# Altium project Sound_Sensor.PrjPcb (part 2 of 3)

## Sheet ADC_2_Section.SchDoc
size A4; DocumentNumber: 7; SheetNumber: 7; SheetTotal: 7
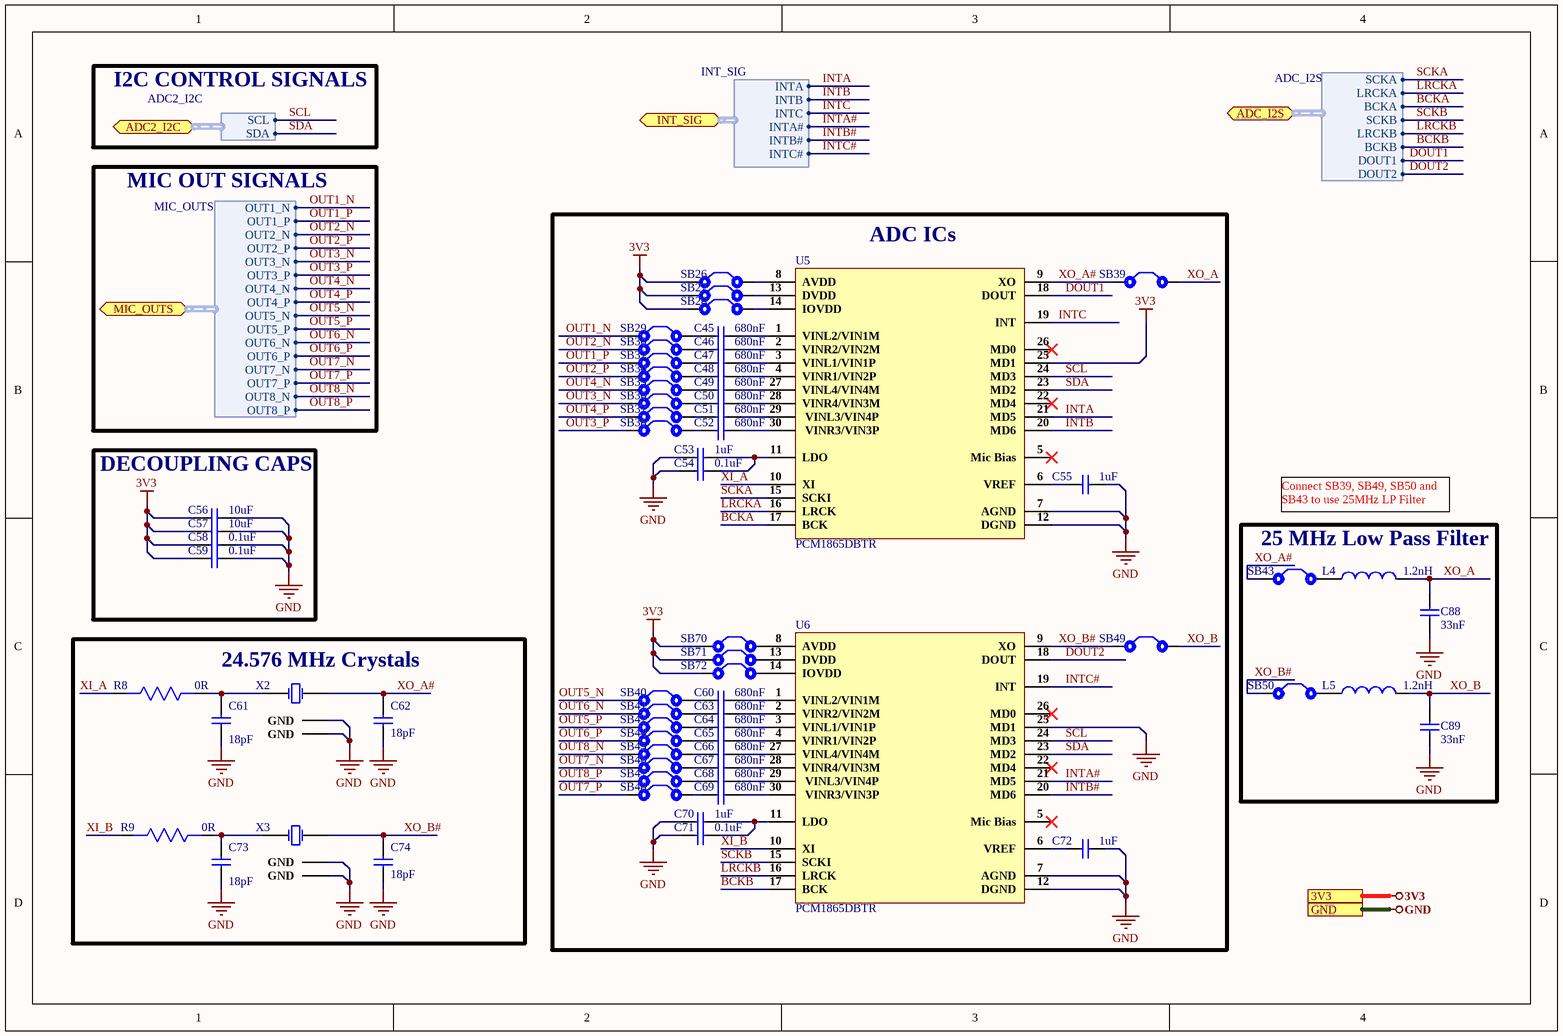
[diagram p3: ADC_2_Section.SchDoc]

### Parts
C45  680nF  [Cap 0603]
C46  680nF  [Cap 0603]
C47  680nF  [Cap 0603]
C48  680nF  [Cap 0603]
C49  680nF  [Cap 0603]
C50  680nF  [Cap 0603]
C51  680nF  [Cap 0603]
C52  680nF  [Cap 0603]
C53  1uF  [Cap 0603]
C54  0.1uF  [Cap 0603]
C55  1uF  [Cap 0603]
C56  10uF  [Cap 0603]
C57  10uF  [Cap 0603]
C58  0.1uF  [Cap 0603]
C59  0.1uF  [Cap 0603]
C60  680nF  [Cap 0603]
C61  18pF  [Cap 0603]
C62  18pF  [Cap 0603]
C63  680nF  [Cap 0603]
C64  680nF  [Cap 0603]
C65  680nF  [Cap 0603]
C66  680nF  [Cap 0603]
C67  680nF  [Cap 0603]
C68  680nF  [Cap 0603]
C69  680nF  [Cap 0603]
C70  1uF  [Cap 0603]
C71  0.1uF  [Cap 0603]
C72  1uF  [Cap 0603]
C73  18pF  [Cap 0603]
C74  18pF  [Cap 0603]
C88  33nF  [Cap 0603]
C89  33nF  [Cap 0603]
L4  1.2nH  [IND 0402]
L5  1.2nH  [IND 0402]
R8  0R  [Res0603]
R9  0R  [Res0603]
SB26  Solder Bridge  [Solder Bridge]  (value not drawn)
SB27  Solder Bridge  [Solder Bridge]  (value not drawn)
SB28  Solder Bridge  [Solder Bridge]  (value not drawn)
SB29  Solder Bridge  [Solder Bridge]  (value not drawn)
SB30  Solder Bridge  [Solder Bridge]  (value not drawn)
SB32  Solder Bridge  [Solder Bridge]  (value not drawn)
SB34  Solder Bridge  [Solder Bridge]  (value not drawn)
SB35  Solder Bridge  [Solder Bridge]  (value not drawn)
SB36  Solder Bridge  [Solder Bridge]  (value not drawn)
SB37  Solder Bridge  [Solder Bridge]  (value not drawn)
SB38  Solder Bridge  [Solder Bridge]  (value not drawn)
SB39  Solder Bridge  [Solder Bridge]  (value not drawn)
SB40  Solder Bridge  [Solder Bridge]  (value not drawn)
SB41  Solder Bridge  [Solder Bridge]  (value not drawn)
SB42  Solder Bridge  [Solder Bridge]  (value not drawn)
SB43  Solder Bridge  [Solder Bridge]  (value not drawn)
SB44  Solder Bridge  [Solder Bridge]  (value not drawn)
SB45  Solder Bridge  [Solder Bridge]  (value not drawn)
SB46  Solder Bridge  [Solder Bridge]  (value not drawn)
SB47  Solder Bridge  [Solder Bridge]  (value not drawn)
SB48  Solder Bridge  [Solder Bridge]  (value not drawn)
SB49  Solder Bridge  [Solder Bridge]  (value not drawn)
SB50  Solder Bridge  [Solder Bridge]  (value not drawn)
SB70  Solder Bridge  [Solder Bridge]  (value not drawn)
SB71  Solder Bridge  [Solder Bridge]  (value not drawn)
SB72  Solder Bridge  [Solder Bridge]  (value not drawn)
U5  PCM1865DBTR  [PCM1865DBTR]
U6  PCM1865DBTR  [PCM1865DBTR]
X2  S3224576121060  [S3224576121060]  (value not drawn)
X3  S3224576121060  [S3224576121060]  (value not drawn)

### Blocks framed on the sheet
ADC ICs: C45-C55 C60 C63-C72 SB26-SB30 SB32 SB34-SB42 SB44-SB49 SB70-SB72 U5 U6
DECOUPLING CAPS: C56-C59
25 MHz Low Pass Filter: C88 C89 L4 L5 SB43 SB50
24.576 MHz Crystals: C61 C62 C73 C74 R8 R9 X2 X3

### Ports
3V3, ADC2_I2C (bidir, harness ADC2_I2C), ADC_I2S (bidir, harness ADC_I2S), GND, INT_SIG (bidir, harness INT_SIG), MIC_OUTS (bidir, harness MIC_OUTS)

### Harnesses
MIC_OUTS: OUT1_N, OUT1_P, OUT2_N, OUT2_P, OUT3_N, OUT3_P, OUT4_N, OUT4_P, OUT5_N, OUT5_P, OUT6_N, OUT6_P, OUT7_N, OUT7_P, OUT8_N, OUT8_P
ADC_I2S: SCKA, LRCKA, BCKA, SCKB, LRCKB, BCKB, DOUT1, DOUT2
INT_SIG: INTA, INTB, INTC, INTA#, INTB#, INTC#
ADC2_I2C: SCL, SDA

### Nets
3V3: C56.1 C57.1 C58.1 C59.1 SB26.1 SB27.1 SB28.1 SB70.1 SB71.1 SB72.1 U5.25(MD1) ; port 3V3
GND: C53.1 C54.1 C55.2 C56.2 C57.2 C58.2 C59.2 C61.1 C62.1 C70.1 C71.1 C72.2 C73.1 C74.1 C88.1 C89.1 U5.7(AGND) U5.12(DGND) U6.7(AGND) U6.12(DGND) U6.25(MD1) X2.2(GND) X2.4(GND) X3.2(GND) X3.4(GND) ; port GND
BCKA: U5.17(BCK) ; port ADC_I2S.BCKA
BCKB: U6.17(BCK) ; port ADC_I2S.BCKB
DOUT1: U5.18(DOUT) ; port ADC_I2S.DOUT1
DOUT2: U6.18(DOUT) ; port ADC_I2S.DOUT2
INTA: U5.21(MD5) ; port INT_SIG.INTA
INTA#: U6.21(MD5) ; port INT_SIG.INTA#
INTB: U5.20(MD6) ; port INT_SIG.INTB
INTB#: U6.20(MD6) ; port INT_SIG.INTB#
INTC: U5.19(INT) ; port INT_SIG.INTC
INTC#: U6.19(INT) ; port INT_SIG.INTC#
LRCKA: U5.16(LRCK) ; port ADC_I2S.LRCKA
LRCKB: U6.16(LRCK) ; port ADC_I2S.LRCKB
OUT1_N: SB29.1 ; port MIC_OUTS.OUT1_N  [project net MIC_OUTS.OUT1_N]
OUT1_P: SB32.1 ; port MIC_OUTS.OUT1_P  [project net MIC_OUTS.OUT1_P]
OUT2_N: SB30.1 ; port MIC_OUTS.OUT2_N  [project net MIC_OUTS.OUT2_N]
OUT2_P: SB34.1 ; port MIC_OUTS.OUT2_P  [project net MIC_OUTS.OUT2_P]
OUT3_N: SB36.1 ; port MIC_OUTS.OUT3_N  [project net MIC_OUTS.OUT3_N]
OUT3_P: SB38.1 ; port MIC_OUTS.OUT3_P  [project net MIC_OUTS.OUT3_P]
OUT4_N: SB35.1 ; port MIC_OUTS.OUT4_N  [project net MIC_OUTS.OUT4_N]
OUT4_P: SB37.1 ; port MIC_OUTS.OUT4_P  [project net MIC_OUTS.OUT4_P]
OUT5_N: SB40.1 ; port MIC_OUTS.OUT5_N  [project net MIC_OUTS.OUT5_N]
OUT5_P: SB42.1 ; port MIC_OUTS.OUT5_P  [project net MIC_OUTS.OUT5_P]
OUT6_N: SB41.1 ; port MIC_OUTS.OUT6_N  [project net MIC_OUTS.OUT6_N]
OUT6_P: SB44.1 ; port MIC_OUTS.OUT6_P  [project net MIC_OUTS.OUT6_P]
OUT7_N: SB46.1 ; port MIC_OUTS.OUT7_N  [project net MIC_OUTS.OUT7_N]
OUT7_P: SB48.1 ; port MIC_OUTS.OUT7_P  [project net MIC_OUTS.OUT7_P]
OUT8_N: SB45.1 ; port MIC_OUTS.OUT8_N  [project net MIC_OUTS.OUT8_N]
OUT8_P: SB47.1 ; port MIC_OUTS.OUT8_P  [project net MIC_OUTS.OUT8_P]
SCKA: U5.15(SCKI) ; port ADC_I2S.SCKA
SCKB: U6.15(SCKI) ; port ADC_I2S.SCKB
SCL: U5.24(MD3) U6.24(MD3) ; port ADC2_I2C.SCL
SDA: U5.23(MD2) U6.23(MD2) ; port ADC2_I2C.SDA
XI_A: R8.2 U5.10(XI)
XI_B: R9.2 U6.10(XI)
XO_A: C88.2 L4.2 SB39.2
XO_A#: C62.2 SB39.1 SB43.1 U5.9(XO) X2.3(OSC2)
XO_B: C89.2 L5.2 SB49.2
XO_B#: C74.2 SB49.1 SB50.1 U6.9(XO) X3.3(OSC2)
NetC45_1: C45.1 SB29.2
NetC45_2: C45.2 U5.1(VINL2/VIN1M)
NetC46_1: C46.1 SB30.2
NetC46_2: C46.2 U5.2(VINR2/VIN2M)
NetC47_1: C47.1 SB32.2
NetC47_2: C47.2 U5.3(VINL1/VIN1P)
NetC48_1: C48.1 SB34.2
NetC48_2: C48.2 U5.4(VINR1/VIN2P)
NetC49_1: C49.1 SB35.2
NetC49_2: C49.2 U5.27(VINL4/VIN4M)
NetC50_1: C50.1 SB36.2
NetC50_2: C50.2 U5.28(VINR4/VIN3M)
NetC51_1: C51.1 SB37.2
NetC51_2: C51.2 U5.29(VINL3/VIN4P)
NetC52_1: C52.1 SB38.2
NetC52_2: C52.2 U5.30(VINR3/VIN3P)
NetC53_2: C53.2 C54.2 U5.11(LDO)
NetC55_1: C55.1 U5.6(VREF)
NetC60_1: C60.1 SB40.2
NetC60_2: C60.2 U6.1(VINL2/VIN1M)
NetC61_2: C61.2 R8.1 X2.1(OSC1)
NetC63_1: C63.1 SB41.2
NetC63_2: C63.2 U6.2(VINR2/VIN2M)
NetC64_1: C64.1 SB42.2
NetC64_2: C64.2 U6.3(VINL1/VIN1P)
NetC65_1: C65.1 SB44.2
NetC65_2: C65.2 U6.4(VINR1/VIN2P)
NetC66_1: C66.1 SB45.2
NetC66_2: C66.2 U6.27(VINL4/VIN4M)
NetC67_1: C67.1 SB46.2
NetC67_2: C67.2 U6.28(VINR4/VIN3M)
NetC68_1: C68.1 SB47.2
NetC68_2: C68.2 U6.29(VINL3/VIN4P)
NetC69_1: C69.1 SB48.2
NetC69_2: C69.2 U6.30(VINR3/VIN3P)
NetC70_2: C70.2 C71.2 U6.11(LDO)
NetC72_1: C72.1 U6.6(VREF)
NetC73_2: C73.2 R9.1 X3.1(OSC1)
NetL4_1: L4.1 SB43.2
NetL5_1: L5.1 SB50.2
NetSB26_2: SB26.2 U5.8(AVDD)
NetSB27_2: SB27.2 U5.13(DVDD)
NetSB28_2: SB28.2 U5.14(IOVDD)
NetSB70_2: SB70.2 U6.8(AVDD)
NetSB71_2: SB71.2 U6.13(DVDD)
NetSB72_2: SB72.2 U6.14(IOVDD)

Not connected (* = marked no-connect by the designer): U5 5(Mic_Bias)* 22(MD4)* 26(MD0)*; U6 5(Mic_Bias)* 22(MD4)* 26(MD0)*

### Notes on the sheet
- I2C CONTROL SIGNALS
- MIC OUT SIGNALS
- Connect SB39, SB49, SB50 and SB43 to use 25MHz LP Filter

### Library data of the parts
C45-C52 C60 C63-C69 = CC0603KRX7R8BB684: CAP CER 0.68uF 25V X7R 10% 0603 Paper T/R; Manufacturer: Yageo; Supplier 1: Arrow Electronics; Manufacturer Part Number: CC0603KRX7R8BB684; RoHS: Yes; Category: Ceramic Capacitors; Stock 1: 8000; Pricing 1: 4000=0.02130, 8000=0.01830 (USD); Supplier Part Number 1: CC0603KRX7R8BB684
C53 C55 C70 C72 = CC0603KRX5R8BB105: CAP CER 1UF 25V X5R 0603; Manufacturer: Yageo; Tolerance: 10%; Supplier 1: Digi-Key; Manufacturer Part Number: CC0603KRX5R8BB105; RoHS: Yes; Category: Ceramic Capacitors; Stock 1: 919939; Pricing 1: 1=0.12000, 10=0.08400, 50=0.04760, 100=0.03940, 500=0.02764, 1000=0.02288 (USD); Mount: Surface Mount; Case/Package: 0603; Number of Pins: 2; Case Code (Metric): 1608; Case Code (Imperial): 0603; Min Operating Temperature: -55°C; Max Operating Temperature: 85°C; Capacitance: 1uF; Dielectric: X5R; Package Quantity: 1; Voltage Rating: 25V; Packaging: Tape and Reel; Termination: SMD/SMT; Voltage Rating (DC): 25V; Series: CC; Construction: Flat; Length: 1.6mm; Width: 0.031inch; Height: 0.8mm; Thickness: 0.035inch; Depth: 0.8mm; Radiation Hardening: No; REACH SVHC: No SVHC; Lead Free: Lead Free; Halogen Free: Halogen Free; RoHS Compliant: Yes; ComponentLink1URL: https://datasheet.ciiva.com/176/mlccorderingcode-176785.pdf?src-supplier=Digi-Key; ComponentLink1Description: https://datasheet.ciiva.com/176/mlccorderingcode-176785.pdf?src-supplier=Digi-Key; ComponentLink2URL: https://datasheet.ciiva.com/176/mlccorderingcode-176786.pdf?src-supplier=Digi-Key; ComponentLink2Description: https://datasheet.ciiva.com/176/mlccorderingcode-176786.pdf?src-supplier=Digi-Key; ComponentLink3URL: https://datasheet.ciiva.com/176/mlccorderingcode-176787.pdf?src-supplier=Digi-Key; ComponentLink3Description: https://datasheet.ciiva.com/176/mlccorderingcode-176787.pdf?src-supplier=Digi-Key; ComponentLink4URL: https://datasheet.ciiva.com/17436/upy-gphc-x5r-4v-to-50v-12-17436952.pdf?src-supplier=Avnet+Europe; ComponentLink4Description: https://datasheet.ciiva.com/17436/upy-gphc-x5r-4v-to-50v-12-17436952.pdf?src-supplier=Avnet+Europe; ComponentLink5URL: https://datasheet.ciiva.com/7978/1525783-7978171.pdf?src-supplier=Element14; ComponentLink5Description: https://datasheet.ciiva.com/7978/1525783-7978171.pdf?src-supplier=Element14; ComponentLink6URL: https://datasheet.ciiva.com/11586/upy-gphc-x5r-4v-to-50v-12-11586318.pdf?src-supplier=Avnet; ComponentLink6Description: https://datasheet.ciiva.com/11586/upy-gphc-x5r-4v-to-50v-12-11586318.pdf?src-supplier=Avnet; Supplier Part Number 1: 311-1445-1-ND
C54 C58 C59 C71 = CC0603KRX7R0BB104: CAP CER 0.1UF 100V X7R 0603; Manufacturer: Yageo; Capacitance: 100nF; Tolerance: 10%; Supplier 1: Digi-Key; Manufacturer Part Number: CC0603KRX7R0BB104; RoHS: Yes; Category: Ceramic Capacitors; Stock 1: 60476; Pricing 1: 1=0.19000, 10=0.13500, 50=0.07680, 100=0.06370, 500=0.04466, 1000=0.03696 (USD); Mount: Surface Mount; Case/Package: 0603; Case Code (Metric): 1608; Case Code (Imperial): 0603; Weight: 7.1E-05oz; Min Operating Temperature: -55°C; Max Operating Temperature: 125°C; Package Quantity: 4000; Voltage Rating: 100V; Packaging: Tape and Reel; Dielectric: X7R; Termination: SMD/SMT; Resistor Type: Ceramic; Voltage Rating (DC): 100V; Series: CC; Length: 0.063inch; Width: 0.031inch; Thickness: 0.035inch; Depth: 0.8mm; Lead Free: Lead Free; RoHS Compliant: Yes; ComponentLink1URL: https://datasheet.ciiva.com/6277/mlccorderingcode-6277030.pdf?src-supplier=Digi-Key; ComponentLink1Description: https://datasheet.ciiva.com/6277/mlccorderingcode-6277030.pdf?src-supplier=Digi-Key; ComponentLink2URL: https://datasheet.ciiva.com/6277/mlccorderingcode-6277081.pdf?src-supplier=Digi-Key; ComponentLink2Description: https://datasheet.ciiva.com/6277/mlccorderingcode-6277081.pdf?src-supplier=Digi-Key; ComponentLink3URL: https://datasheet.ciiva.com/6277/mlccorderingcode-6277082.pdf?src-supplier=Digi-Key; ComponentLink3Description: https://datasheet.ciiva.com/6277/mlccorderingcode-6277082.pdf?src-supplier=Digi-Key; Supplier Part Number 1: 311-1523-1-ND
C56 C57 = CL10A106MA8NRNC: CAP CER 10UF 25V X5R 0603; Manufacturer: Samsung; Tolerance: 20%; Supplier 1: Avnet; Manufacturer Part Number: CL10A106MA8NRNC; RoHS: Yes; Category: Ceramic Capacitors; Pricing 1: 4000=0.03753, 8000=0.03700, 16000=0.03595, 24000=0.03515, 32000=0.03383, 40000=0.03304, 400000=0.03225 (USD); Mount: Surface Mount; Case/Package: 0603; Case Code (Metric): 1608; Case Code (Imperial): 0603; Contact Plating: Tin; Min Operating Temperature: -55°C; Max Operating Temperature: 85°C; Package Quantity: 1; Packaging: Tape and Reel; Capacitance: 10uF; Voltage Rating: 25V; Dielectric: X5R; Termination: Wraparound; Series: CL; Construction: Flat; Length: 0.063inch; Width: 0.031inch; Thickness: 0.035inch; Lead Free: Lead Free; RoHS Compliant: Yes; ComponentLink1URL: https://datasheet.ciiva.com/25766/cl10a106ma8nrnc-25766562.pdf?src-supplier=Digi-Key; ComponentLink1Description: https://datasheet.ciiva.com/25766/cl10a106ma8nrnc-25766562.pdf?src-supplier=Digi-Key; Supplier Part Number 1: CL10A106MA8NRNC
C61 C62 C73 C74 = CC0603JRNPO9BN180: CAP SMD 18pF ±5.0% 50V NPO 0603; Manufacturer: Yageo; Tolerance: 5%; Dielectric: C0G; Temperature Coefficient: 30ppm/°C; Insulation Resistance: 100GR; Supplier 1: Newark; Manufacturer Part Number: CC0603JRNPO9BN180; RoHS: Yes; Category: Ceramic Capacitors; Stock 1: 77880; Pricing 1: 1=0.09900, 25=0.08000, 50=0.06900, 100=0.04700, 250=0.03600, 500=0.02800, 1000=0.02300, 2500=0.01900 (USD); Mount: Surface Mount; Case/Package: 0603; Number of Pins: 2; Case Code (Metric): 1608; Case Code (Imperial): 0603; Min Operating Temperature: -55°C; Max Operating Temperature: 125°C; Capacitance: 18pF; Packaging: Tape and Reel; Voltage Rating: 50V; Voltage Rating (DC): 50V; Package Quantity: 1; Termination: SMD/SMT; Resistor Type: Ceramic; Series: CC; Length: 1.6mm; Width: 0.031inch; Height: 0.8mm; Thickness: 0.035inch; Depth: 0.8mm; Radiation Hardening: No; REACH SVHC: No SVHC; Lead Free: Lead Free; RoHS Compliant: Yes; ComponentLink1URL: https://datasheet.ciiva.com/144/mlccorderingcode-144638.pdf?src-supplier=Digi-Key; ComponentLink1Description: https://datasheet.ciiva.com/144/mlccorderingcode-144638.pdf?src-supplier=Digi-Key; ComponentLink2URL: https://datasheet.ciiva.com/144/mlccorderingcode-144637.pdf?src-supplier=Digi-Key; ComponentLink2Description: https://datasheet.ciiva.com/144/mlccorderingcode-144637.pdf?src-supplier=Digi-Key; ComponentLink3URL: https://datasheet.ciiva.com/144/mlccorderingcode-144639.pdf?src-supplier=Digi-Key; ComponentLink3Description: https://datasheet.ciiva.com/144/mlccorderingcode-144639.pdf?src-supplier=Digi-Key; ComponentLink4URL: https://datasheet.ciiva.com/28450/1443161-28450477.pdf?src-supplier=Element14; ComponentLink4Description: https://datasheet.ciiva.com/28450/1443161-28450477.pdf?src-supplier=Element14; ComponentLink5URL: https://datasheet.ciiva.com/46430/1835847-46430152.pdf?src-supplier=Element14; ComponentLink5Description: https://datasheet.ciiva.com/46430/1835847-46430152.pdf?src-supplier=Element14; ComponentLink6URL: https://datasheet.ciiva.com/5425/upy-gp-np0-16v-to-50v-8-5425439.pdf?src-supplier=Mouser; ComponentLink6Description: https://datasheet.ciiva.com/5425/upy-gp-np0-16v-to-50v-8-5425439.pdf?src-supplier=Mouser; ComponentLink7URL: https://datasheet.ciiva.com/8033/1734582-8033733.pdf?src-supplier=Element14; ComponentLink7Description: https://datasheet.ciiva.com/8033/1734582-8033733.pdf?src-supplier=Element14; ComponentLink8URL: https://datasheet.ciiva.com/11587/upy-gp-np0-16v-to-50v-8-11587323.pdf?src-supplier=Avnet; ComponentLink8Description: https://datasheet.ciiva.com/11587/upy-gp-np0-16v-to-50v-8-11587323.pdf?src-supplier=Avnet; Supplier Part Number 1: 68R4719
C88 C89 = CC0603KRX7R8BB333: CAP CER 33000pF ±10% 25V X7R 0603; Manufacturer: Yageo; Supplier 1: Newark; Manufacturer Part Number: CC0603KRX7R8BB333; RoHS: Yes; Category: Ceramic Capacitors; Stock 1: 52000; Pricing 1: 1=0.01800, 4000=0.01800, 8000=0.01300 (USD); Mount: Surface Mount; Case/Package: 0603; Number of Pins: 2; Case Code (Imperial): 0603; Case Code (Metric): 1608; Weight: 7.1E-05oz; Min Operating Temperature: -55°C; Max Operating Temperature: 125°C; Tolerance: 10%; Voltage Rating: 25V; Capacitance: 33nF; Voltage Rating (DC): 25V; Packaging: Tape and Reel; Dielectric: X7R; Termination: SMD/SMT; Resistor Type: Ceramic; Series: CC; Length: 1.6mm; Width: 0.031inch; Height: 0.8mm; Thickness: 0.035inch; Depth: 0.8mm; Radiation Hardening: No; Lead Free: Lead Free; Halogen Free: Halogen Free; RoHS Compliant: Yes; ComponentLink1URL: https://datasheet.ciiva.com/11465/upy-gphc-x7r-6-3v-to-50v-8-11465208.pdf?src-supplier=Avnet; ComponentLink1Description: https://datasheet.ciiva.com/11465/upy-gphc-x7r-6-3v-to-50v-8-11465208.pdf?src-supplier=Avnet; ComponentLink2URL: https://datasheet.ciiva.com/15189/getdatasheetpartid-355839-15189164.pdf?src-supplier=Verical; ComponentLink2Description: https://datasheet.ciiva.com/15189/getdatasheetpartid-355839-15189164.pdf?src-supplier=Verical; Supplier Part Number 1: 50AJ2719
L4 L5 = LQG15HS1N2S02D: FIXED IND 1.2NH 1A 90 MOHM SMD; Manufacturer: Murata; Core Material: Air; DC Resistance (DCR): 90mR; Max DC Current: 300mA; Shielding: Unshielded; Q Factor: 8; Self Resonant Frequency: 6GHz; Test Frequency: 100MHz; Supplier 1: RSComponents; Manufacturer Part Number: LQG15HS1N2S02D; RoHS: Yes; Category: Fixed Inductors; Stock 1: 1; Pricing 1: 100=0.04000, 5000=0.02800, 10000=0.02200, 20000=0.02000, 50000=0.01700 (USD); Mount: Surface Mount; Case/Package: 0402; Case Code (Metric): 1005; Case Code (Imperial): 0402; Min Operating Temperature: -55°C; Max Operating Temperature: 125°C; Inductance: 1.2nH; Package Quantity: 10000; Current Rating: 300mA; Packaging: Tape and Reel; Termination: SMD/SMT; DC Current: 300mA; Series: LQG15HS; Rated Current-Max: 300mA; Length: 1mm; Width: 0.02inch; Height: 0.5mm; Height - Seated (Max): 0.022inch; Depth: 0.55mm; Radiation Hardening: No; Military Standard: Not; Lead Free: Lead Free; RoHS Compliant: Yes; ComponentLink1URL: https://datasheet.ciiva.com/11801/0900766b8090d53b-11801370.pdf?src-supplier=RSComponents; ComponentLink1Description: https://datasheet.ciiva.com/11801/0900766b8090d53b-11801370.pdf?src-supplier=RSComponents; ComponentLink2URL: https://datasheet.ciiva.com/16207/product-16207869.pdf?src-supplier=Future+Electronics; ComponentLink2Description: https://datasheet.ciiva.com/16207/product-16207869.pdf?src-supplier=Future+Electronics; ComponentLink3URL: https://datasheet.ciiva.com/1038/l0075s0083lqg15hs-1038116.pdf?src-supplier=Digi-Key; ComponentLink3Description: https://datasheet.ciiva.com/1038/l0075s0083lqg15hs-1038116.pdf?src-supplier=Digi-Key; ComponentLink4URL: https://datasheet.ciiva.com/1038/l0075s0083lqg15hs-1038115.pdf?src-supplier=Digi-Key; ComponentLink4Description: https://datasheet.ciiva.com/1038/l0075s0083lqg15hs-1038115.pdf?src-supplier=Digi-Key; ComponentLink5URL: https://datasheet.ciiva.com/1038/l0075s0083lqg15hs-1038117.pdf?src-supplier=Digi-Key; ComponentLink5Description: https://datasheet.ciiva.com/1038/l0075s0083lqg15hs-1038117.pdf?src-supplier=Digi-Key; ComponentLink6URL: https://datasheet.ciiva.com/4977/o05e-4977850.pdf?src-supplier=Mouser; ComponentLink6Description: https://datasheet.ciiva.com/4977/o05e-4977850.pdf?src-supplier=Mouser; ComponentLink7URL: https://datasheet.ciiva.com/8510/l0075s0083lqg15hs-8510828.pdf?src-supplier=Avnet; ComponentLink7Description: https://datasheet.ciiva.com/8510/l0075s0083lqg15hs-8510828.pdf?src-supplier=Avnet; Supplier Part Number 1: 8119795
R8 R9 = RC0603FR-070RL: RES SMD 0R, 1%, 0.1W, 0603; Manufacturer: Yageo; Resistance: 0mR; Power Rating: 100mW; Voltage Rating (DC): 50V; Temperature Coefficient: 200ppm/°C; Current Rating: 1A; Working Voltage: 75V; Supplier 1: Arrow Electronics; Manufacturer Part Number: RC0603FR-070RL; RoHS: Yes; Category: Chip SMD Resistors; Stock 1: 1270000; Pricing 1: 5000=0.00320, 5000=0.00490, 50000=0.00450, 500000=0.00250, 2500000=0.00150 (USD); Case/Package: 0603; Number of Pins: 2; Contact Plating: Tin,Matte; Case Code (Metric): 1608; Case Code (Imperial): 0603; Min Operating Temperature: -55°C; Max Operating Temperature: 155°C; Resistor Type: Thick Film; Packaging: Tape and Reel; Tolerance: 1%; Package Quantity: 5000; Voltage Rating: 50V; Number of Terminations: 2; Termination: SMD/SMT; Max Power Dissipation: 100mW; Features: Moisture Resistant; Length: 1.6mm; Width: 0.031inch; Height: 0.45mm; Depth: 0.8mm; Radiation Hardening: No; REACH SVHC: No SVHC; Lead Free: Lead Free; Military Standard: Not; ComponentLink1URL: https://datasheet.ciiva.com/11808/0900766b80f96399-11808172.pdf?src-supplier=RSComponents; ComponentLink1Description: https://datasheet.ciiva.com/11808/0900766b80f96399-11808172.pdf?src-supplier=RSComponents; ComponentLink2URL: https://datasheet.ciiva.com/5558/rc0603-272842-5558341.pdf?src-supplier=Mouser; ComponentLink2Description: https://datasheet.ciiva.com/5558/rc0603-272842-5558341.pdf?src-supplier=Mouser; ComponentLink3URL: https://datasheet.ciiva.com/46382/443971-46382072.pdf?src-supplier=Element14; ComponentLink3Description: https://datasheet.ciiva.com/46382/443971-46382072.pdf?src-supplier=Element14; ComponentLink4URL: https://datasheet.ciiva.com/29721/pyu-r-int-thick-7-29721178.pdf?src-supplier=Digi-Key; ComponentLink4Description: https://datasheet.ciiva.com/29721/pyu-r-int-thick-7-29721178.pdf?src-supplier=Digi-Key; ComponentLink5URL: https://datasheet.ciiva.com/5684/443971-5684699.pdf?src-supplier=Farnell; ComponentLink5Description: https://datasheet.ciiva.com/5684/443971-5684699.pdf?src-supplier=Farnell; ComponentLink6URL: https://datasheet.ciiva.com/7983/443971-7983627.pdf?src-supplier=Element14; ComponentLink6Description: https://datasheet.ciiva.com/7983/443971-7983627.pdf?src-supplier=Element14; ComponentLink7URL: https://datasheet.ciiva.com/29721/pyu-rc0603-51-rohs-l-4-29721179.pdf?src-supplier=Digi-Key; ComponentLink7Description: https://datasheet.ciiva.com/29721/pyu-rc0603-51-rohs-l-4-29721179.pdf?src-supplier=Digi-Key; ComponentLink8URL: https://datasheet.ciiva.com/22643/1868787-22643388.pdf?src-supplier=Element14; ComponentLink8Description: https://datasheet.ciiva.com/22643/1868787-22643388.pdf?src-supplier=Element14; Supplier Part Number 1: RC0603FR-070RL
SB26-SB30 SB32 SB34-SB50 SB70-SB72 = Solder Bridge: Solder Bridge ON
U5 U6 = PCM1865DBTR: IC ADC/AUDIO 24BIT 192K 30TSSOP; Manufacturer: Texas Instruments; Interface: I2C,SPI,Serial; Operating Supply Voltage: 3.3V; Sampling Rate: 192KS/s; Resolution: 24b; Operating Supply Current: 31mA; Supply Type: Single; Number of A/D Converters: 4; Power Consumption: 145mW; Max Supply Voltage: 3.6V; Min Supply Voltage: 3V; Number of Analog Inputs: 8; Number of DAC Channels: 0; Supplier 1: Mouser; Manufacturer Part Number: PCM1865DBTR; RoHS: Yes; Category: Amplifiers - Audio; Pricing 1: 1=10.72000, 10=9.69000, 25=9.23000, 50=9.23000, 100=8.02000, 250=7.66000, 500=6.98000, 1000=6.54000, 10000=6.54000 (USD); Mount: Surface Mount; Case/Package: TSSOP; Number of Pins: 30; Weight: 0.003439oz; Contact Plating: Gold; Min Operating Temperature: -40°C; Max Operating Temperature: 125°C; Package Quantity: 2000; Packaging: Tape and Reel; Number of ADC Channels: 4; Lead Free: Lead Free; RoHS Compliant: Yes; ComponentLink1URL: https://datasheet.ciiva.com/48474/pcm1861-48474798.pdf?src-supplier=Avnet; ComponentLink1Description: https://datasheet.ciiva.com/48474/pcm1861-48474798.pdf?src-supplier=Avnet; ComponentLink2URL: https://datasheet.ciiva.com/29699/pcm1861-29699238.pdf?src-supplier=Digi-Key; ComponentLink2Description: https://datasheet.ciiva.com/29699/pcm1861-29699238.pdf?src-supplier=Digi-Key; Supplier Part Number 1: 595-PCM1865DBTR
X2 X3 = S3224576121060: 24.576MHz SMD Crystal Resonator 12pF 60Ω ±10ppm -40℃~+85℃ SMD3225-4P Crystals ROHS; Manufacturer: JGHC; Manufacturer Part Number: S3224576121060; Footprint: Custom; ComponentLink1Description: LCSC; ComponentLink1URL: https://lcsc.com/product-detail/Crystals_JGHC-S3224576121060_C390772.html; Value: 24.576MHz

## Sheet ADC_1_Section.SchDoc
size A4; DocumentNumber: 6; SheetNumber: 6; SheetTotal: 7
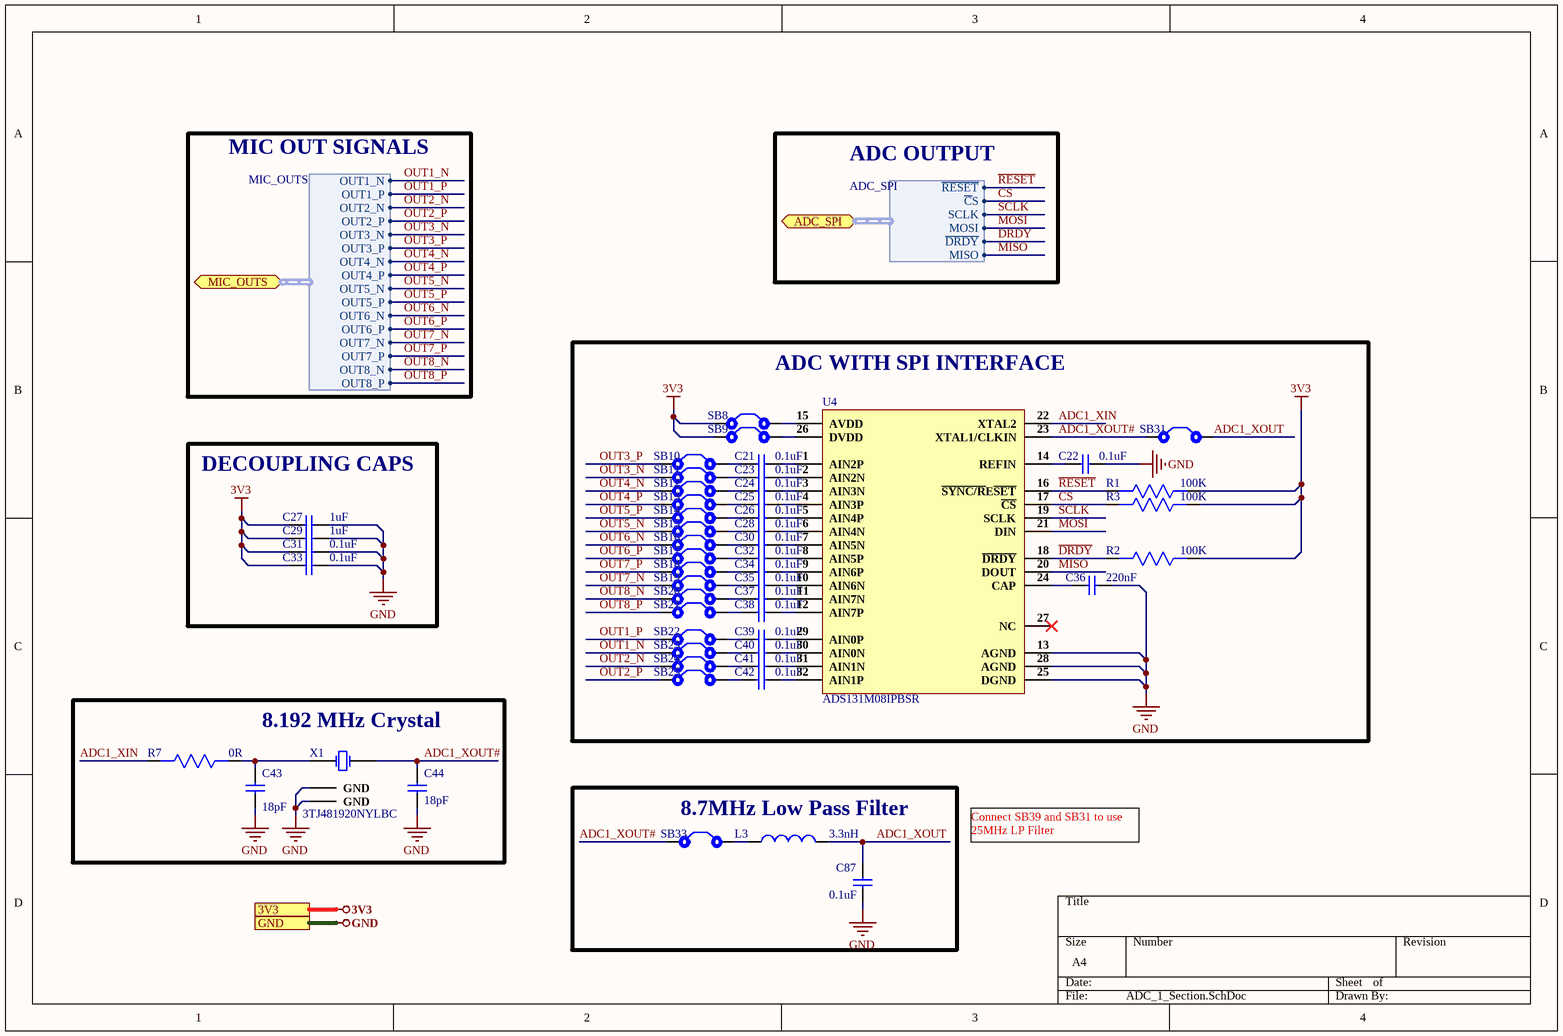
[diagram p4: ADC_1_Section.SchDoc]

### Parts
C21  0.1uF  [Cap 0603]
C22  0.1uF  [Cap 0603]
C23  0.1uF  [Cap 0603]
C24  0.1uF  [Cap 0603]
C25  0.1uF  [Cap 0603]
C26  0.1uF  [Cap 0603]
C27  1uF  [Cap 0603]
C28  0.1uF  [Cap 0603]
C29  1uF  [Cap 0603]
C30  0.1uF  [Cap 0603]
C31  0.1uF  [Cap 0603]
C32  0.1uF  [Cap 0603]
C33  0.1uF  [Cap 0603]
C34  0.1uF  [Cap 0603]
C35  0.1uF  [Cap 0603]
C36  220nF  [Cap 0603]
C37  0.1uF  [Cap 0603]
C38  0.1uF  [Cap 0603]
C39  0.1uF  [Cap 0603]
C40  0.1uF  [Cap 0603]
C41  0.1uF  [Cap 0603]
C42  0.1uF  [Cap 0603]
C43  18pF  [Cap 0603]
C44  18pF  [Cap 0603]
C87  0.1uF  [Cap 0603]
L3  3.3nH  [IND 0603]
R1  100K  [Res0603]
R2  100K  [Res0603]
R3  100K  [Res0603]
R7  0R  [Res0603]
SB8  Solder Bridge  [Solder Bridge]  (value not drawn)
SB9  Solder Bridge  [Solder Bridge]  (value not drawn)
SB10  Solder Bridge  [Solder Bridge]  (value not drawn)
SB11  Solder Bridge  [Solder Bridge]  (value not drawn)
SB12  Solder Bridge  [Solder Bridge]  (value not drawn)
SB13  Solder Bridge  [Solder Bridge]  (value not drawn)
SB14  Solder Bridge  [Solder Bridge]  (value not drawn)
SB15  Solder Bridge  [Solder Bridge]  (value not drawn)
SB16  Solder Bridge  [Solder Bridge]  (value not drawn)
SB17  Solder Bridge  [Solder Bridge]  (value not drawn)
SB18  Solder Bridge  [Solder Bridge]  (value not drawn)
SB19  Solder Bridge  [Solder Bridge]  (value not drawn)
SB20  Solder Bridge  [Solder Bridge]  (value not drawn)
SB21  Solder Bridge  [Solder Bridge]  (value not drawn)
SB22  Solder Bridge  [Solder Bridge]  (value not drawn)
SB23  Solder Bridge  [Solder Bridge]  (value not drawn)
SB24  Solder Bridge  [Solder Bridge]  (value not drawn)
SB25  Solder Bridge  [Solder Bridge]  (value not drawn)
SB31  Solder Bridge  [Solder Bridge]  (value not drawn)
SB33  Solder Bridge  [Solder Bridge]  (value not drawn)
U4  ADS131M08IPBSR  [32TQFP]
X1  3TJ481920NYLBC  [3TJ481920NYLBC]

### Blocks framed on the sheet
ADC WITH SPI INTERFACE: C21-C26 C28 C30 C32 C34-C42 R1-R3 SB8-SB25 SB31 U4
DECOUPLING CAPS: C27 C29 C31 C33
8.192 MHz Crystal: C43 C44 R7 X1
8.7MHz Low Pass Filter: C87 L3 SB33

### Ports
3V3, ADC_SPI (bidir, harness ADC_SPI), GND, MIC_OUTS (bidir, harness MIC_OUTS)

### Harnesses
MIC_OUTS: OUT1_N, OUT1_P, OUT2_N, OUT2_P, OUT3_N, OUT3_P, OUT4_N, OUT4_P, OUT5_N, OUT5_P, OUT6_N, OUT6_P, OUT7_N, OUT7_P, OUT8_N, OUT8_P
ADC_SPI: ~{RESET}, ~{C}S, SCLK, MOSI, ~{DRDY}, MISO

### Nets
3V3: C27.1 C29.1 C31.1 C33.1 R1.1 R2.1 R3.1 SB8.1 SB9.1 ; port 3V3
GND: C22.2 C27.2 C29.2 C31.2 C33.2 C36.2 C43.1 C44.1 C87.1 U4.13(AGND) U4.25(DGND) U4.28(AGND) X1.2(GND) X1.4(GND) ; port GND
~{C}S: R3.2 U4.17(~{CS}) ; port ADC_SPI.~{C}S
~{DRDY}: R2.2 U4.18(~{DRDY}) ; port ADC_SPI.~{DRDY}
~{RESET}: R1.2 U4.16(~{SYNC/R}E~{SET}) ; port ADC_SPI.~{RESET}
ADC1_XIN: R7.2 U4.22(XTAL2)
ADC1_XOUT: C87.2 L3.2 SB31.2
ADC1_XOUT#: C44.2 SB31.1 SB33.1 U4.23(XTAL1/CLKIN) X1.3(OSC2)
MISO: U4.20(DOUT) ; port ADC_SPI.MISO
MOSI: U4.21(DIN) ; port ADC_SPI.MOSI
OUT1_N: SB23.1 ; port MIC_OUTS.OUT1_N  [project net MIC_OUTS.OUT1_N]
OUT1_P: SB22.1 ; port MIC_OUTS.OUT1_P  [project net MIC_OUTS.OUT1_P]
OUT2_N: SB24.1 ; port MIC_OUTS.OUT2_N  [project net MIC_OUTS.OUT2_N]
OUT2_P: SB25.1 ; port MIC_OUTS.OUT2_P  [project net MIC_OUTS.OUT2_P]
OUT3_N: SB11.1 ; port MIC_OUTS.OUT3_N  [project net MIC_OUTS.OUT3_N]
OUT3_P: SB10.1 ; port MIC_OUTS.OUT3_P  [project net MIC_OUTS.OUT3_P]
OUT4_N: SB12.1 ; port MIC_OUTS.OUT4_N  [project net MIC_OUTS.OUT4_N]
OUT4_P: SB13.1 ; port MIC_OUTS.OUT4_P  [project net MIC_OUTS.OUT4_P]
OUT5_N: SB15.1 ; port MIC_OUTS.OUT5_N  [project net MIC_OUTS.OUT5_N]
OUT5_P: SB14.1 ; port MIC_OUTS.OUT5_P  [project net MIC_OUTS.OUT5_P]
OUT6_N: SB16.1 ; port MIC_OUTS.OUT6_N  [project net MIC_OUTS.OUT6_N]
OUT6_P: SB17.1 ; port MIC_OUTS.OUT6_P  [project net MIC_OUTS.OUT6_P]
OUT7_N: SB19.1 ; port MIC_OUTS.OUT7_N  [project net MIC_OUTS.OUT7_N]
OUT7_P: SB18.1 ; port MIC_OUTS.OUT7_P  [project net MIC_OUTS.OUT7_P]
OUT8_N: SB20.1 ; port MIC_OUTS.OUT8_N  [project net MIC_OUTS.OUT8_N]
OUT8_P: SB21.1 ; port MIC_OUTS.OUT8_P  [project net MIC_OUTS.OUT8_P]
SCLK: U4.19(SCLK) ; port ADC_SPI.SCLK
NetC21_1: C21.1 SB10.2
NetC21_2: C21.2 U4.1(AIN2P)
NetC22_1: C22.1 U4.14(REFIN)
NetC23_1: C23.1 SB11.2
NetC23_2: C23.2 U4.2(AIN2N)
NetC24_1: C24.1 SB12.2
NetC24_2: C24.2 U4.3(AIN3N)
NetC25_1: C25.1 SB13.2
NetC25_2: C25.2 U4.4(AIN3P)
NetC26_1: C26.1 SB14.2
NetC26_2: C26.2 U4.5(AIN4P)
NetC28_1: C28.1 SB15.2
NetC28_2: C28.2 U4.6(AIN4N)
NetC30_1: C30.1 SB16.2
NetC30_2: C30.2 U4.7(AIN5N)
NetC32_1: C32.1 SB17.2
NetC32_2: C32.2 U4.8(AIN5P)
NetC34_1: C34.1 SB18.2
NetC34_2: C34.2 U4.9(AIN6P)
NetC35_1: C35.1 SB19.2
NetC35_2: C35.2 U4.10(AIN6N)
NetC36_1: C36.1 U4.24(CAP)
NetC37_1: C37.1 SB20.2
NetC37_2: C37.2 U4.11(AIN7N)
NetC38_1: C38.1 SB21.2
NetC38_2: C38.2 U4.12(AIN7P)
NetC39_1: C39.1 SB22.2
NetC39_2: C39.2 U4.29(AIN0P)
NetC40_1: C40.1 SB23.2
NetC40_2: C40.2 U4.30(AIN0N)
NetC41_1: C41.1 SB24.2
NetC41_2: C41.2 U4.31(AIN1N)
NetC42_1: C42.1 SB25.2
NetC42_2: C42.2 U4.32(AIN1P)
NetC43_2: C43.2 R7.1 X1.1(OSC1)
NetL3_1: L3.1 SB33.2
NetSB8_2: SB8.2 U4.15(AVDD)
NetSB9_2: SB9.2 U4.26(DVDD)

Not connected (* = marked no-connect by the designer): U4 27(NC)*

### Notes on the sheet
- MIC OUT SIGNALS
- ADC OUTPUT
- Connect SB39 and SB31 to use 25MHz LP Filter

### Library data of the parts
C21-C26 C28 C30-C35 C37-C42 C87 = CC0603KRX7R0BB104: as C54 on sheet ADC_2_Section; Supplier 1: Digi-Key; Manufacturer Part Number: CC0603KRX7R0BB104; RoHS: Yes; Category: Ceramic Capacitors; Stock 1: 60476; Pricing 1: 1=0.19000, 10=0.13500, 50=0.07680, 100=0.06370, 500=0.04466, 1000=0.03696 (USD); Mount: Surface Mount; Case/Package: 0603; Case Code (Metric): 1608; Case Code (Imperial): 0603; Weight: 7.1E-05oz; Min Operating Temperature: -55°C; Max Operating Temperature: 125°C; Package Quantity: 4000; Voltage Rating: 100V; Packaging: Tape and Reel; Dielectric: X7R; Termination: SMD/SMT; Resistor Type: Ceramic; Voltage Rating (DC): 100V; Series: CC; Length: 0.063inch; Width: 0.031inch; Thickness: 0.035inch; Depth: 0.8mm; Lead Free: Lead Free; RoHS Compliant: Yes; ComponentLink1URL: https://datasheet.ciiva.com/6277/mlccorderingcode-6277030.pdf?src-supplier=Digi-Key; ComponentLink1Description: https://datasheet.ciiva.com/6277/mlccorderingcode-6277030.pdf?src-supplier=Digi-Key; ComponentLink2URL: https://datasheet.ciiva.com/6277/mlccorderingcode-6277081.pdf?src-supplier=Digi-Key; ComponentLink2Description: https://datasheet.ciiva.com/6277/mlccorderingcode-6277081.pdf?src-supplier=Digi-Key; ComponentLink3URL: https://datasheet.ciiva.com/6277/mlccorderingcode-6277082.pdf?src-supplier=Digi-Key; ComponentLink3Description: https://datasheet.ciiva.com/6277/mlccorderingcode-6277082.pdf?src-supplier=Digi-Key; Supplier Part Number 1: 311-1523-1-ND
C27 C29 = CC0603KRX5R8BB105: as C53 on sheet ADC_2_Section; Supplier 1: Digi-Key; Manufacturer Part Number: CC0603KRX5R8BB105; RoHS: Yes; Category: Ceramic Capacitors; Stock 1: 919939; Pricing 1: 1=0.12000, 10=0.08400, 50=0.04760, 100=0.03940, 500=0.02764, 1000=0.02288 (USD); Mount: Surface Mount; Case/Package: 0603; Number of Pins: 2; Case Code (Metric): 1608; Case Code (Imperial): 0603; Min Operating Temperature: -55°C; Max Operating Temperature: 85°C; Capacitance: 1uF; Dielectric: X5R; Package Quantity: 1; Voltage Rating: 25V; Packaging: Tape and Reel; Termination: SMD/SMT; Voltage Rating (DC): 25V; Series: CC; Construction: Flat; Length: 1.6mm; Width: 0.031inch; Height: 0.8mm; Thickness: 0.035inch; Depth: 0.8mm; Radiation Hardening: No; REACH SVHC: No SVHC; Lead Free: Lead Free; Halogen Free: Halogen Free; RoHS Compliant: Yes; ComponentLink1URL: https://datasheet.ciiva.com/176/mlccorderingcode-176785.pdf?src-supplier=Digi-Key; ComponentLink1Description: https://datasheet.ciiva.com/176/mlccorderingcode-176785.pdf?src-supplier=Digi-Key; ComponentLink2URL: https://datasheet.ciiva.com/176/mlccorderingcode-176786.pdf?src-supplier=Digi-Key; ComponentLink2Description: https://datasheet.ciiva.com/176/mlccorderingcode-176786.pdf?src-supplier=Digi-Key; ComponentLink3URL: https://datasheet.ciiva.com/176/mlccorderingcode-176787.pdf?src-supplier=Digi-Key; ComponentLink3Description: https://datasheet.ciiva.com/176/mlccorderingcode-176787.pdf?src-supplier=Digi-Key; ComponentLink4URL: https://datasheet.ciiva.com/17436/upy-gphc-x5r-4v-to-50v-12-17436952.pdf?src-supplier=Avnet+Europe; ComponentLink4Description: https://datasheet.ciiva.com/17436/upy-gphc-x5r-4v-to-50v-12-17436952.pdf?src-supplier=Avnet+Europe; ComponentLink5URL: https://datasheet.ciiva.com/7978/1525783-7978171.pdf?src-supplier=Element14; ComponentLink5Description: https://datasheet.ciiva.com/7978/1525783-7978171.pdf?src-supplier=Element14; ComponentLink6URL: https://datasheet.ciiva.com/11586/upy-gphc-x5r-4v-to-50v-12-11586318.pdf?src-supplier=Avnet; ComponentLink6Description: https://datasheet.ciiva.com/11586/upy-gphc-x5r-4v-to-50v-12-11586318.pdf?src-supplier=Avnet; Supplier Part Number 1: 311-1445-1-ND
C36 = UMK107C7224KAHTE: CAP CER 0.22UF 50V X7S 0603; Manufacturer: Taiyo Yuden; Tolerance: 10%; Supplier 1: RSComponents; Manufacturer Part Number: UMK107C7224KAHTE; RoHS: Yes; Category: Ceramic Capacitors; Stock 1: 1; Pricing 1: 4000=0.05100, 8000=0.04300 (USD); Mount: Surface Mount; Case/Package: 0603; Min Operating Temperature: -55°C; Max Operating Temperature: 125°C; Packaging: Cut Tape; Capacitance: 220nF; Voltage Rating: 50V; Ratings: AEC-Q200; ComponentLink1URL: http://ds.yuden.co.jp/TYCOMPAS/ut/detail.do?productNo=UMK107C7224KAHTE&fileName=UMK107C7224KAHTE_SS&mode=specSheetDownload&src-supplier=Digi-Key; ComponentLink1Description: http://ds.yuden.co.jp/TYCOMPAS/ut/detail.do?productNo=UMK107C7224KAHTE&fileName=UMK107C7224KAHTE_SS&mode=specSheetDownload&src-supplier=Digi-Key; Supplier Part Number 1: 1843164
C43 C44 = CC0603JRNPO9BN180: as C61 on sheet ADC_2_Section; Supplier 1: Newark; Manufacturer Part Number: CC0603JRNPO9BN180; RoHS: Yes; Category: Ceramic Capacitors; Stock 1: 77880; Pricing 1: 1=0.09900, 25=0.08000, 50=0.06900, 100=0.04700, 250=0.03600, 500=0.02800, 1000=0.02300, 2500=0.01900 (USD); Mount: Surface Mount; Case/Package: 0603; Number of Pins: 2; Case Code (Metric): 1608; Case Code (Imperial): 0603; Min Operating Temperature: -55°C; Max Operating Temperature: 125°C; Capacitance: 18pF; Packaging: Tape and Reel; Voltage Rating: 50V; Voltage Rating (DC): 50V; Package Quantity: 1; Termination: SMD/SMT; Resistor Type: Ceramic; Series: CC; Length: 1.6mm; Width: 0.031inch; Height: 0.8mm; Thickness: 0.035inch; Depth: 0.8mm; Radiation Hardening: No; REACH SVHC: No SVHC; Lead Free: Lead Free; RoHS Compliant: Yes; ComponentLink1URL: https://datasheet.ciiva.com/144/mlccorderingcode-144638.pdf?src-supplier=Digi-Key; ComponentLink1Description: https://datasheet.ciiva.com/144/mlccorderingcode-144638.pdf?src-supplier=Digi-Key; ComponentLink2URL: https://datasheet.ciiva.com/144/mlccorderingcode-144637.pdf?src-supplier=Digi-Key; ComponentLink2Description: https://datasheet.ciiva.com/144/mlccorderingcode-144637.pdf?src-supplier=Digi-Key; ComponentLink3URL: https://datasheet.ciiva.com/144/mlccorderingcode-144639.pdf?src-supplier=Digi-Key; ComponentLink3Description: https://datasheet.ciiva.com/144/mlccorderingcode-144639.pdf?src-supplier=Digi-Key; ComponentLink4URL: https://datasheet.ciiva.com/28450/1443161-28450477.pdf?src-supplier=Element14; ComponentLink4Description: https://datasheet.ciiva.com/28450/1443161-28450477.pdf?src-supplier=Element14; ComponentLink5URL: https://datasheet.ciiva.com/46430/1835847-46430152.pdf?src-supplier=Element14; ComponentLink5Description: https://datasheet.ciiva.com/46430/1835847-46430152.pdf?src-supplier=Element14; ComponentLink6URL: https://datasheet.ciiva.com/5425/upy-gp-np0-16v-to-50v-8-5425439.pdf?src-supplier=Mouser; ComponentLink6Description: https://datasheet.ciiva.com/5425/upy-gp-np0-16v-to-50v-8-5425439.pdf?src-supplier=Mouser; ComponentLink7URL: https://datasheet.ciiva.com/8033/1734582-8033733.pdf?src-supplier=Element14; ComponentLink7Description: https://datasheet.ciiva.com/8033/1734582-8033733.pdf?src-supplier=Element14; ComponentLink8URL: https://datasheet.ciiva.com/11587/upy-gp-np0-16v-to-50v-8-11587323.pdf?src-supplier=Avnet; ComponentLink8Description: https://datasheet.ciiva.com/11587/upy-gp-np0-16v-to-50v-8-11587323.pdf?src-supplier=Avnet; Supplier Part Number 1: 68R4719
L3 = LQG18HN3N3S00D: FIXED IND 3.3NH 1A 120 MOHM SMD; Manufacturer: Murata; Core Material: Air; Max DC Current: 500mA; DC Resistance (DCR): 150mR; Q Factor: 12; Self Resonant Frequency: 6GHz; Shielding: Unshielded; Test Frequency: 100MHz; Supplier 1: RSComponents; Manufacturer Part Number: LQG18HN3N3S00D; RoHS: Yes; Category: Fixed Inductors; Stock 1: 1; Pricing 1: 10=0.18800, 500=0.08200, 1000=0.07100, 2000=0.05900, 5000=0.05600 (USD); Mount: Surface Mount; Case/Package: 0603; Case Code (Metric): 1608; Case Code (Imperial): 0603; Min Operating Temperature: -55°C; Max Operating Temperature: 85°C; Inductance: 3.3nH; Packaging: Tape and Reel; Package Quantity: 4000; Current Rating: 500mA; Termination: SMD/SMT; DC Current: 500mA; Series: LQG18H; Rated Current-Max: 500mA; Length: 1.6mm; Width: 0.8mm; Height: 0.8mm; Height - Seated (Max): 0.037inch; Depth: 0.95mm; Radiation Hardening: No; REACH SVHC: No SVHC; Military Standard: Not; Lead Free: Lead Free; RoHS Compliant: Yes; ComponentLink1URL: https://datasheet.ciiva.com/11801/0900766b80f1087c-11801482.pdf?src-supplier=RSComponents; ComponentLink1Description: https://datasheet.ciiva.com/11801/0900766b80f1087c-11801482.pdf?src-supplier=RSComponents; ComponentLink2URL: https://datasheet.ciiva.com/8510/l0075s0083lqg18h-8510694.pdf?src-supplier=Avnet; ComponentLink2Description: https://datasheet.ciiva.com/8510/l0075s0083lqg18h-8510694.pdf?src-supplier=Avnet; ComponentLink3URL: https://datasheet.ciiva.com/8002/5102-8002599.pdf?src-supplier=Element14; ComponentLink3Description: https://datasheet.ciiva.com/8002/5102-8002599.pdf?src-supplier=Element14; ComponentLink4URL: https://datasheet.ciiva.com/6690/l0075s0083lqg18h-6690799.pdf?src-supplier=Digi-Key; ComponentLink4Description: https://datasheet.ciiva.com/6690/l0075s0083lqg18h-6690799.pdf?src-supplier=Digi-Key; ComponentLink5URL: https://datasheet.ciiva.com/4978/o05e-4978491.pdf?src-supplier=Mouser; ComponentLink5Description: https://datasheet.ciiva.com/4978/o05e-4978491.pdf?src-supplier=Mouser; ComponentLink6URL: https://datasheet.ciiva.com/18089/getdatasheetpartid-180322-18089964.pdf?src-supplier=Verical; ComponentLink6Description: https://datasheet.ciiva.com/18089/getdatasheetpartid-180322-18089964.pdf?src-supplier=Verical; ComponentLink7URL: https://datasheet.ciiva.com/6690/l0075s0083lqg18h-6690797.pdf?src-supplier=Digi-Key; ComponentLink7Description: https://datasheet.ciiva.com/6690/l0075s0083lqg18h-6690797.pdf?src-supplier=Digi-Key; ComponentLink8URL: https://datasheet.ciiva.com/6690/l0075s0083lqg18h-6690798.pdf?src-supplier=Digi-Key; ComponentLink8Description: https://datasheet.ciiva.com/6690/l0075s0083lqg18h-6690798.pdf?src-supplier=Digi-Key; Supplier Part Number 1: 7254954
R1-R3 = CRGH0603J100K: RES SMD 100K OHM 5% 1/5W 0603; Manufacturer: TE Connectivity; Resistance: 100kR; Temperature Coefficient: 100ppm/°C; Power Rating: 200mW; Voltage Rating: 50V; Number of Resistors: 1; Supplier 1: Digi-Key; Manufacturer Part Number: CRGH0603J100K; Stock 1: 23277; Pricing 1: 1=0.1, 10=0.049, 100=0.02, 1000=0.00899, 2500=0.0078 (USD); Mount: Surface Mount; Case/Package: 0603; Case Code (Imperial): 0603; Case Code (Metric): 1608; Min Operating Temperature: -55°C; Max Operating Temperature: 125°C; Tolerance: 5%; Packaging: Tape and Reel; Resistor Type: Thick Film,Power resistor; Number of Terminations: 2; Series: CRGH; Termination: Solder; Voltage Rating (DC): 50V; Resistance Tolerance: 5%; Technology: THICK FILM; Length: 1.6mm; Width: 0.8mm; Height: 0.45mm; Depth: 0.8mm; RoHS Compliant: Yes; REACH SVHC: No SVHC; ELV: Compliant; ComponentLink1URL: http://www.farnell.com/datasheets/2007183.pdf?src-supplier=Element14; ComponentLink1Description: http://www.farnell.com/datasheets/2007183.pdf?src-supplier=Element14; Supplier Part Number 1: A126393DKR-ND
R7 = RC0603FR-070RL: as R8 on sheet ADC_2_Section; Supplier 1: Arrow Electronics; Manufacturer Part Number: RC0603FR-070RL; RoHS: Yes; Category: Chip SMD Resistors; Stock 1: 1270000; Pricing 1: 5000=0.00320, 5000=0.00490, 50000=0.00450, 500000=0.00250, 2500000=0.00150 (USD); Case/Package: 0603; Number of Pins: 2; Contact Plating: Tin,Matte; Case Code (Metric): 1608; Case Code (Imperial): 0603; Min Operating Temperature: -55°C; Max Operating Temperature: 155°C; Resistor Type: Thick Film; Packaging: Tape and Reel; Tolerance: 1%; Package Quantity: 5000; Voltage Rating: 50V; Number of Terminations: 2; Termination: SMD/SMT; Max Power Dissipation: 100mW; Features: Moisture Resistant; Length: 1.6mm; Width: 0.031inch; Height: 0.45mm; Depth: 0.8mm; Radiation Hardening: No; REACH SVHC: No SVHC; Lead Free: Lead Free; Military Standard: Not; ComponentLink1URL: https://datasheet.ciiva.com/11808/0900766b80f96399-11808172.pdf?src-supplier=RSComponents; ComponentLink1Description: https://datasheet.ciiva.com/11808/0900766b80f96399-11808172.pdf?src-supplier=RSComponents; ComponentLink2URL: https://datasheet.ciiva.com/5558/rc0603-272842-5558341.pdf?src-supplier=Mouser; ComponentLink2Description: https://datasheet.ciiva.com/5558/rc0603-272842-5558341.pdf?src-supplier=Mouser; ComponentLink3URL: https://datasheet.ciiva.com/46382/443971-46382072.pdf?src-supplier=Element14; ComponentLink3Description: https://datasheet.ciiva.com/46382/443971-46382072.pdf?src-supplier=Element14; ComponentLink4URL: https://datasheet.ciiva.com/29721/pyu-r-int-thick-7-29721178.pdf?src-supplier=Digi-Key; ComponentLink4Description: https://datasheet.ciiva.com/29721/pyu-r-int-thick-7-29721178.pdf?src-supplier=Digi-Key; ComponentLink5URL: https://datasheet.ciiva.com/5684/443971-5684699.pdf?src-supplier=Farnell; ComponentLink5Description: https://datasheet.ciiva.com/5684/443971-5684699.pdf?src-supplier=Farnell; ComponentLink6URL: https://datasheet.ciiva.com/7983/443971-7983627.pdf?src-supplier=Element14; ComponentLink6Description: https://datasheet.ciiva.com/7983/443971-7983627.pdf?src-supplier=Element14; ComponentLink7URL: https://datasheet.ciiva.com/29721/pyu-rc0603-51-rohs-l-4-29721179.pdf?src-supplier=Digi-Key; ComponentLink7Description: https://datasheet.ciiva.com/29721/pyu-rc0603-51-rohs-l-4-29721179.pdf?src-supplier=Digi-Key; ComponentLink8URL: https://datasheet.ciiva.com/22643/1868787-22643388.pdf?src-supplier=Element14; ComponentLink8Description: https://datasheet.ciiva.com/22643/1868787-22643388.pdf?src-supplier=Element14; Supplier Part Number 1: RC0603FR-070RL
SB8-SB25 SB31 SB33 = Solder Bridge: Solder Bridge ON
U4 = ADS131M08IPBSR: IC ADC 24BIT SIGMA-DELTA 32TQFP; Manufacturer: Texas Instruments; Supplier 1: Mouser; Manufacturer Part Number: ADS131M08IPBSR; RoHS: Yes; Category: Analog to Digital Converters (ADCs); Pricing 1: 1=8.85000, 10=7.99000, 50=7.62000, 100=6.62000, 1000=5.39000, 10000=5.39000 (USD); Supplier Part Number 1: 595-ADS131M08IPBSR
X1 = 3TJ481920NYLBC: 8.192MHz SMD Crystal Resonator 12pF 150Ω ±10ppm ±30ppm -40℃~+85℃ SMD_3225_4P Crystals ROHS; Manufacturer: JYJE; Manufacturer Part No: 3TJ481920NYLBC; Package: Custom